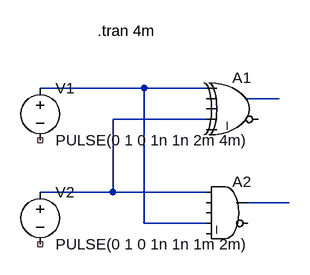
[diagram p0: schematic HA.asc]
HA.asc, the LTspice schematic file:
Version 4.1
SHEET 1 880 680
WIRE 240 48 80 48
WIRE 336 48 240 48
WIRE 448 64 400 64
WIRE 336 96 192 96
WIRE 192 208 192 96
WIRE 192 208 80 208
WIRE 336 208 192 208
WIRE 464 224 400 224
WIRE 240 256 240 48
WIRE 336 256 240 256
SYMBOL voltage 80 32 R0
WINDOW 123 0 0 Left 0
WINDOW 39 0 0 Left 0
SYMATTR InstName V1
SYMATTR Value PULSE(0 1 0 1n 1n 2m 4m)
SYMBOL voltage 80 192 R0
WINDOW 123 0 0 Left 0
WINDOW 39 0 0 Left 0
SYMATTR InstName V2
SYMATTR Value PULSE(0 1 0 1n 1n 1m 2m)
SYMBOL Digital\\xor 384 16 R0
SYMATTR InstName A1
SYMBOL Digital\\and 368 176 R0
SYMATTR InstName A2
TEXT 168 -40 Left 2 !.tran 4m

The netlist it stands for:
* HA.asc
V1 N001 NC_01 PULSE(0 1 0 1n 1n 2m 4m)
V2 N003 NC_02 PULSE(0 1 0 1n 1n 1m 2m)
A1 N001 0 0 N003 0 0 N002 0 XOR
A2 N003 0 0 N001 0 0 N004 0 AND
.tran 4m
.backanno
.end